# EasyEDA Pro project wavie-rgb-board.epro

# Schematic Schematic1
Board Name: Board1; Create Date: 2026-03-26; Page Name: P1; Project Name: Wavie RGB Board; Schematic Name: Schematic1; Update Date: 2026-06-10; Company: ReefMetrics; Page Size: A4; Version: V1.0
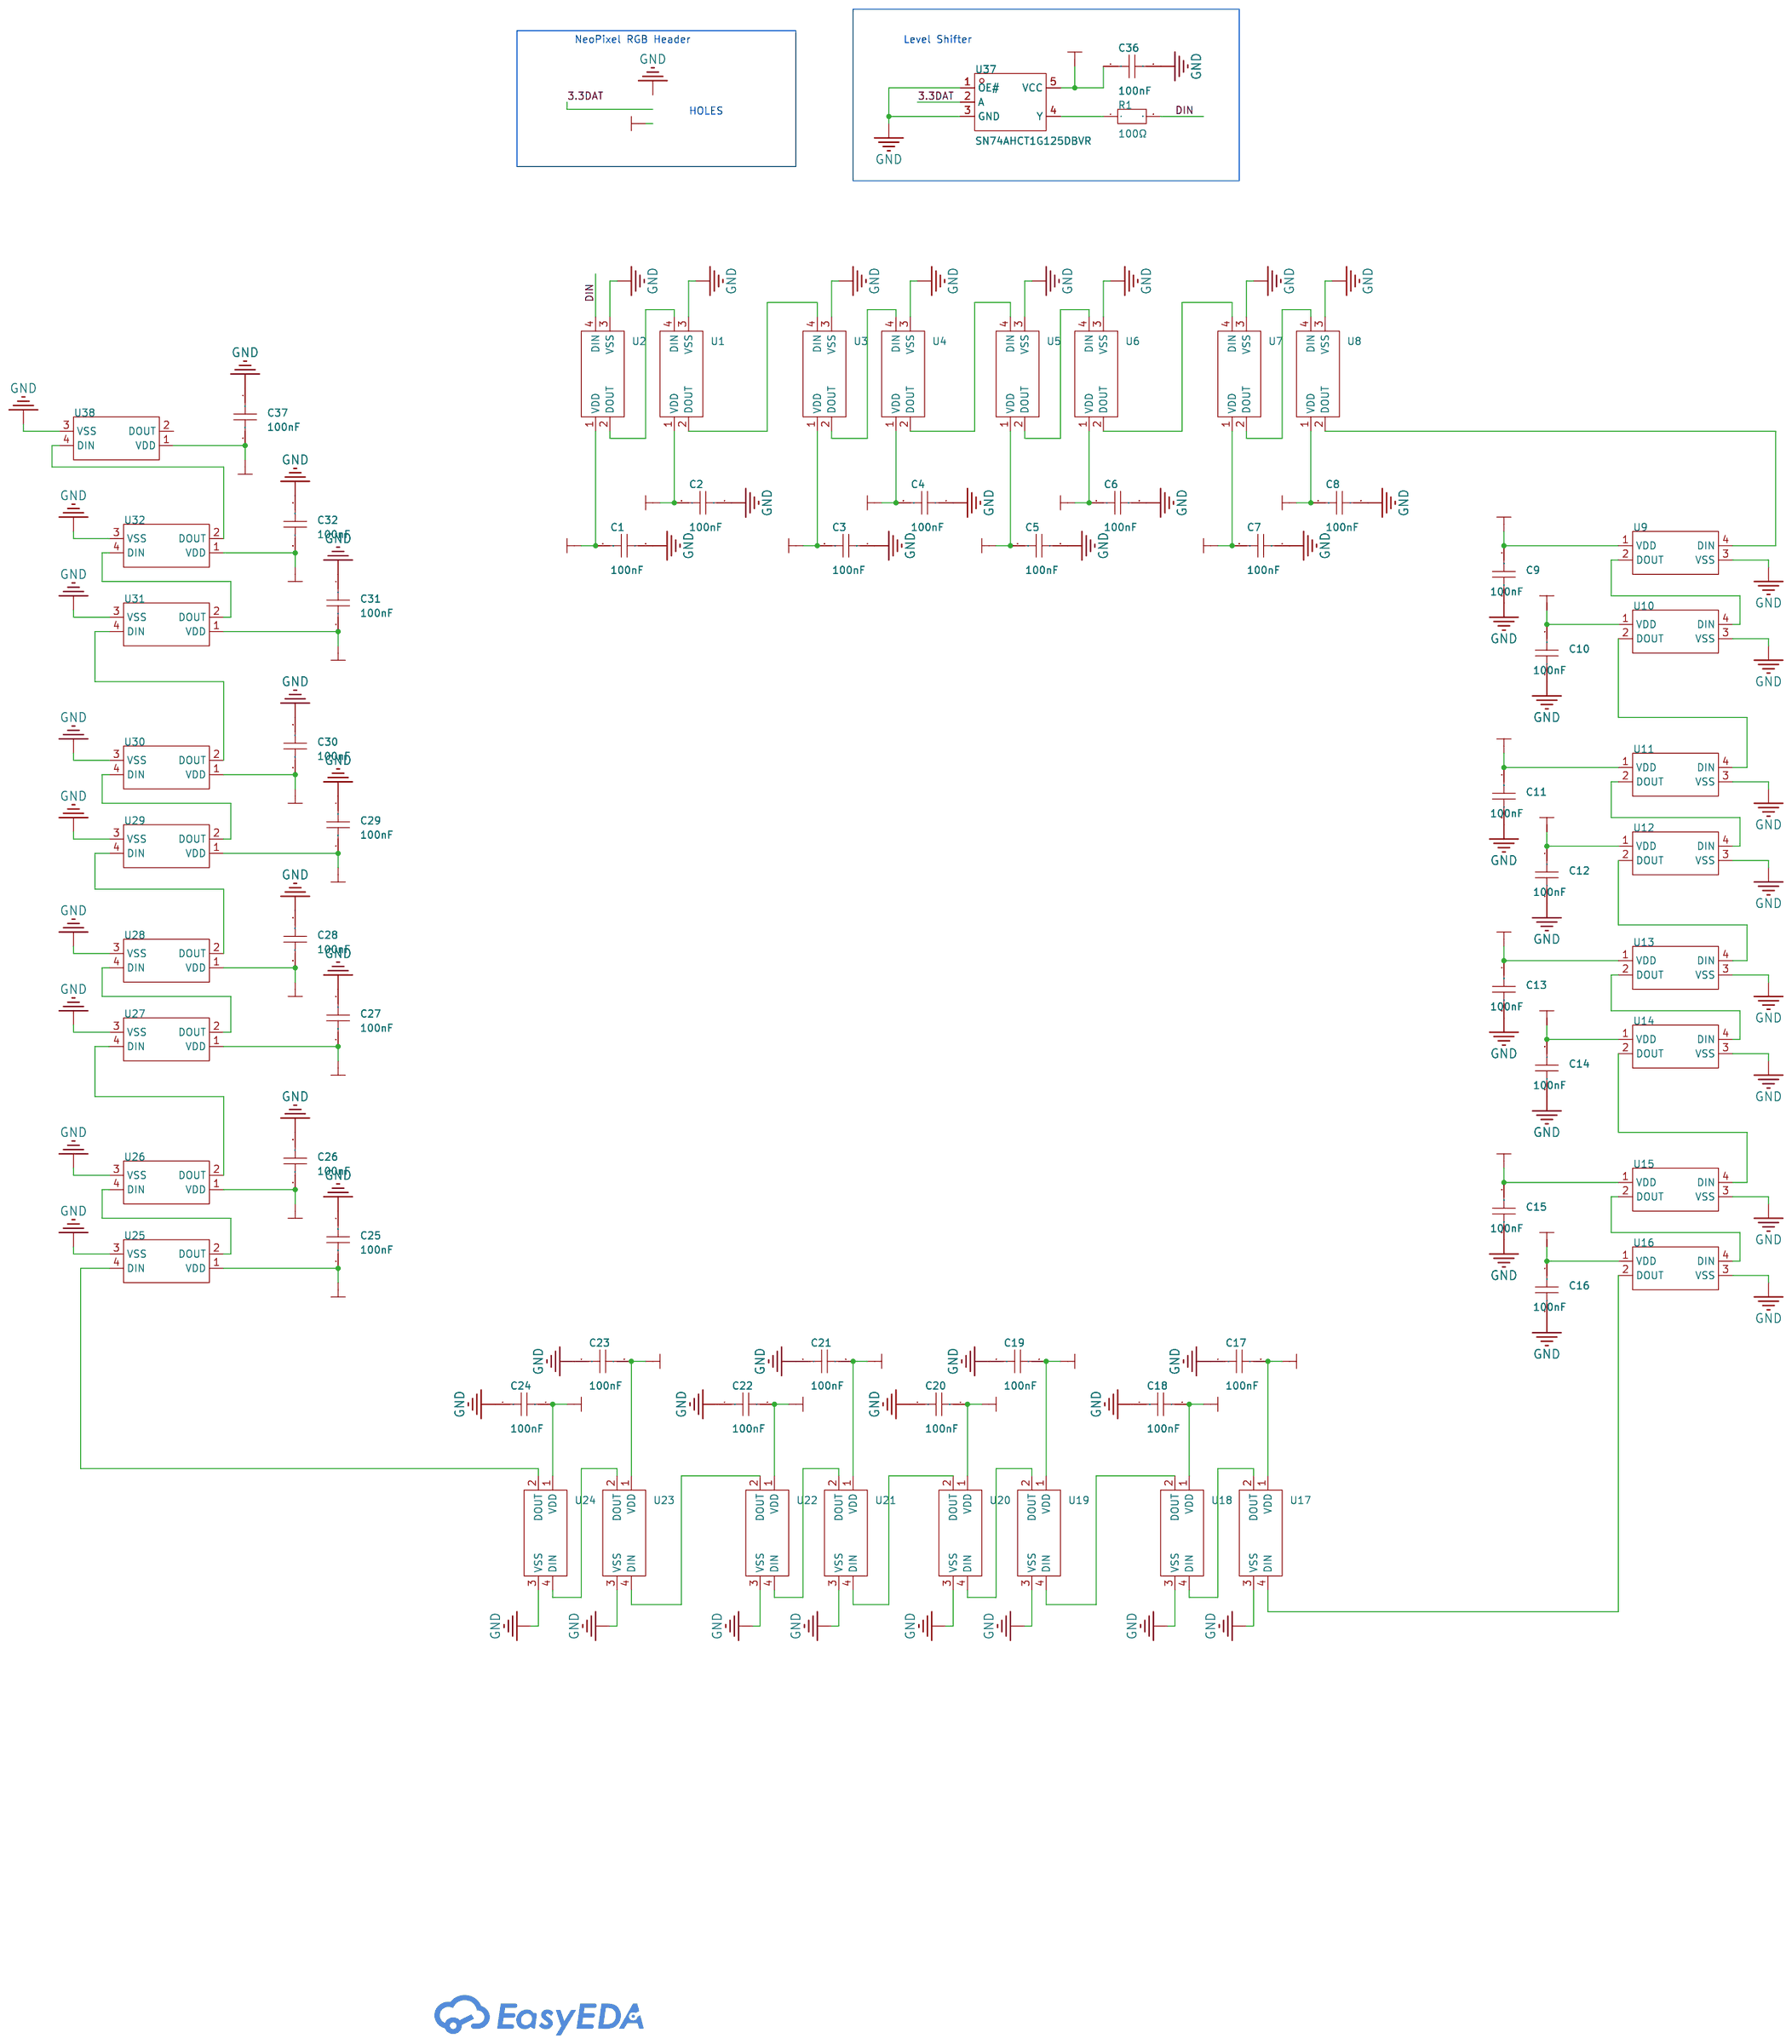
[diagram p0: schematic sheet]

## Parts
C1  100nF  [C0603]
C2  100nF  [C0603]
C3  100nF  [C0603]
C4  100nF  [C0603]
C5  100nF  [C0603]
C6  100nF  [C0603]
C7  100nF  [C0603]
C8  100nF  [C0603]
C9  100nF  [C0603]
C10  100nF  [C0603]
C11  100nF  [C0603]
C12  100nF  [C0603]
C13  100nF  [C0603]
C14  100nF  [C0603]
C15  100nF  [C0603]
C16  100nF  [C0603]
C17  100nF  [C0603]
C18  100nF  [C0603]
C19  100nF  [C0603]
C20  100nF  [C0603]
C21  100nF  [C0603]
C22  100nF  [C0603]
C23  100nF  [C0603]
C24  100nF  [C0603]
C25  100nF  [C0603]
C26  100nF  [C0603]
C27  100nF  [C0603]
C28  100nF  [C0603]
C29  100nF  [C0603]
C30  100nF  [C0603]
C31  100nF  [C0603]
C32  100nF  [C0603]
C36  100nF  [C0603]
C37  100nF  [C0603]
R1  100Ω  [R0603]
U1  WS2812B-MINI-V6  [LED-SMD_4P-L3.5-W3.5-TL_WS2812B]
U2  WS2812B-MINI-V6  [LED-SMD_4P-L3.5-W3.5-TL_WS2812B]
U3  WS2812B-MINI-V6  [LED-SMD_4P-L3.5-W3.5-TL_WS2812B]
U4  WS2812B-MINI-V6  [LED-SMD_4P-L3.5-W3.5-TL_WS2812B]
U5  WS2812B-MINI-V6  [LED-SMD_4P-L3.5-W3.5-TL_WS2812B]
U6  WS2812B-MINI-V6  [LED-SMD_4P-L3.5-W3.5-TL_WS2812B]
U7  WS2812B-MINI-V6  [LED-SMD_4P-L3.5-W3.5-TL_WS2812B]
U8  WS2812B-MINI-V6  [LED-SMD_4P-L3.5-W3.5-TL_WS2812B]
U9  WS2812B-MINI-V6  [LED-SMD_4P-L3.5-W3.5-TL_WS2812B]
U10  WS2812B-MINI-V6  [LED-SMD_4P-L3.5-W3.5-TL_WS2812B]
U11  WS2812B-MINI-V6  [LED-SMD_4P-L3.5-W3.5-TL_WS2812B]
U12  WS2812B-MINI-V6  [LED-SMD_4P-L3.5-W3.5-TL_WS2812B]
U13  WS2812B-MINI-V6  [LED-SMD_4P-L3.5-W3.5-TL_WS2812B]
U14  WS2812B-MINI-V6  [LED-SMD_4P-L3.5-W3.5-TL_WS2812B]
U15  WS2812B-MINI-V6  [LED-SMD_4P-L3.5-W3.5-TL_WS2812B]
U16  WS2812B-MINI-V6  [LED-SMD_4P-L3.5-W3.5-TL_WS2812B]
U17  WS2812B-MINI-V6  [LED-SMD_4P-L3.5-W3.5-TL_WS2812B]
U18  WS2812B-MINI-V6  [LED-SMD_4P-L3.5-W3.5-TL_WS2812B]
U19  WS2812B-MINI-V6  [LED-SMD_4P-L3.5-W3.5-TL_WS2812B]
U20  WS2812B-MINI-V6  [LED-SMD_4P-L3.5-W3.5-TL_WS2812B]
U21  WS2812B-MINI-V6  [LED-SMD_4P-L3.5-W3.5-TL_WS2812B]
U22  WS2812B-MINI-V6  [LED-SMD_4P-L3.5-W3.5-TL_WS2812B]
U23  WS2812B-MINI-V6  [LED-SMD_4P-L3.5-W3.5-TL_WS2812B]
U24  WS2812B-MINI-V6  [LED-SMD_4P-L3.5-W3.5-TL_WS2812B]
U25  WS2812B-MINI-V6  [LED-SMD_4P-L3.5-W3.5-TL_WS2812B]
U26  WS2812B-MINI-V6  [LED-SMD_4P-L3.5-W3.5-TL_WS2812B]
U27  WS2812B-MINI-V6  [LED-SMD_4P-L3.5-W3.5-TL_WS2812B]
U28  WS2812B-MINI-V6  [LED-SMD_4P-L3.5-W3.5-TL_WS2812B]
U29  WS2812B-MINI-V6  [LED-SMD_4P-L3.5-W3.5-TL_WS2812B]
U30  WS2812B-MINI-V6  [LED-SMD_4P-L3.5-W3.5-TL_WS2812B]
U31  WS2812B-MINI-V6  [LED-SMD_4P-L3.5-W3.5-TL_WS2812B]
U32  WS2812B-MINI-V6  [LED-SMD_4P-L3.5-W3.5-TL_WS2812B]
U37  SN74AHCT1G125DBVR  [SOT-23-5_L3.0-W1.7-P0.95-LS2.8-BR]
U38  WS2812B-MINI-V6  [LED-SMD_4P-L3.5-W3.5-TL_WS2812B]

## Library data of the parts
C1-C32 C37 = CC0603KRX7R9BB104: Capacitance:100nF Tolerance:±10% Tolerance:±10% Voltage Rating:50V Temperature Coefficient:X7R; LCSC Part Name: 100nF ±10% 50V; Supplier Part: C14663; Manufacturer: YAGEO(国巨); Supplier Footprint: 0603; Datasheet: https://item.szlcsc.com/datasheet/CC0603KRX7R9BB104/15331.html; Supplier: LCSC; Tolerance: ±10%; Voltage Rating: 50V; Temperature Coefficient: X7R
C36 = 0603ZD104KAT2A: Capacitance:100nF Tolerance:±10% Tolerance:±10% Voltage Rating:10V Temperature Coefficient:X5R; LCSC Part Name: 100nF ±10% 10V; Supplier Part: C1856507; Manufacturer: Kyocera AVX; Supplier Footprint: 0603; JLCPCB Part Class: Extended Part; Supplier: LCSC; Tolerance: ±10%; Voltage Rating: 10V; Temperature Coefficient: X5R
R1 = THD03G1000BT: Type:Thin Film Resistor Resistance:100Ω Tolerance:±0.1% Tolerance:±0.1% Power(Watts):100mW Voltage-Supply(Max):75V Temperature Coefficient:±25ppm/℃ Temperature Coefficient:±25ppm/℃ Operating Temperature:-55℃~+155℃ Operating Temperature:-55℃~+155℃; LCSC Part Name: 薄膜电阻 100Ω ±0.1% 100mW; Supplier Part: C47120007; Manufacturer: FH(风华); Supplier Footprint: 0603; JLCPCB Part Class: Extended Part; Datasheet: https://item.szlcsc.com/datasheet/THD03G1000BT/49315409.html; Supplier: LCSC; Type: Thin Film Resistor; Tolerance: ±0.1%; Power(Watts): 100mW; Voltage-Supply(Max): 75V; Temperature Coefficient: ±25ppm/℃; Operating Temperature: -55℃~+155℃
U1-U32 U38 = WS2812B-MINI-V6: Supplier Part: C52941386; Manufacturer: worldsemi; Supplier Footprint: SMD3535-4P; JLCPCB Part Class: Extended Part; Datasheet: https://item.szlcsc.com/datasheet/WS2812B-MINI-V6/55856749.html; Supplier: LCSC
U37 = SN74AHCT1G125DBVR: Input type:- output type:Tri-State Voltage - Supply:4.5V~5.5V Voltage - Supply:4.5V~5.5V Number of Elements:1 Number of Bits per Element:1 Channel Type:Unidirectional Current - Output Low(IOL):8mA Current - Output High(IOH):8mA Logic Family:74AHCT Operati; LCSC Part Name: 三态输出，单路总线缓冲门; Supplier Part: C7484; Manufacturer: TI(德州仪器); Supplier Footprint: SOT-23-5; Datasheet: https://www.ti.com/cn/lit/gpn/sn74ahct1g125; Supplier: LCSC; output type: Tri-State; Voltage - Supply: 4.5V~5.5V; Number of Elements: 1; Number of Bits per Element: 1; Channel Type: Unidirectional; Current - Output Low(IOL): 8mA; Current - Output High(IOH): 8mA; Logic Family: 74AHCT; Operating Temperature: -40℃~+125℃; Quiescent Current: 10uA; Propagation Delay: 6.5ns@5V,15pF

## Nets
5V: C1.2 C2.2 C3.2 C4.2 C5.2 C6.2 C7.2 C8.2 C9.2 C10.2 C11.2 C12.2 C13.2 C14.2 C15.2 C16.2 C17.2 C18.2 C19.2 C20.2 C21.2 C22.2 C23.2 C24.2 C25.2 C26.2 C27.2 C28.2 C29.2 C30.2 C31.2 C32.2 C36.1 C37.2 U1.1(VDD) U2.1(VDD) U3.1(VDD) U4.1(VDD) U5.1(VDD) U6.1(VDD) U7.1(VDD) U8.1(VDD) U9.1(VDD) U10.1(VDD) U11.1(VDD) U12.1(VDD) U13.1(VDD) U14.1(VDD) U15.1(VDD) U16.1(VDD) U17.1(VDD) U18.1(VDD) U19.1(VDD) U20.1(VDD) U21.1(VDD) U22.1(VDD) U23.1(VDD) U24.1(VDD) U25.1(VDD) U26.1(VDD) U27.1(VDD) U28.1(VDD) U29.1(VDD) U30.1(VDD) U31.1(VDD) U32.1(VDD) U37.5(VCC) U38.1(VDD)
GND: C1.1 C2.1 C3.1 C4.1 C5.1 C6.1 C7.1 C8.1 C9.1 C10.1 C11.1 C12.1 C13.1 C14.1 C15.1 C16.1 C17.1 C18.1 C19.1 C20.1 C21.1 C22.1 C23.1 C24.1 C25.1 C26.1 C27.1 C28.1 C29.1 C30.1 C31.1 C32.1 C36.2 C37.1 U1.3(VSS) U2.3(VSS) U3.3(VSS) U4.3(VSS) U5.3(VSS) U6.3(VSS) U7.3(VSS) U8.3(VSS) U9.3(VSS) U10.3(VSS) U11.3(VSS) U12.3(VSS) U13.3(VSS) U14.3(VSS) U15.3(VSS) U16.3(VSS) U17.3(VSS) U18.3(VSS) U19.3(VSS) U20.3(VSS) U21.3(VSS) U22.3(VSS) U23.3(VSS) U24.3(VSS) U25.3(VSS) U26.3(VSS) U27.3(VSS) U28.3(VSS) U29.3(VSS) U30.3(VSS) U31.3(VSS) U32.3(VSS) U37.1(OE#) U37.3(GND) U38.3(VSS)
3.3DAT: U37.2(A)
DIN: R1.2 U2.4(DIN)
$1N3068: U1.4(DIN) U2.2(DOUT)
$1N3711: U3.2(DOUT) U4.4(DIN)
$1N3739: U1.2(DOUT) U3.4(DIN)
$1N4176: U5.2(DOUT) U6.4(DIN)
$1N4201: U7.2(DOUT) U8.4(DIN)
$1N4218: U6.2(DOUT) U7.4(DIN)
$1N4237: U4.2(DOUT) U5.4(DIN)
$1N5098: U9.2(DOUT) U10.4(DIN)
$1N5123: U11.2(DOUT) U12.4(DIN)
$1N5140: U10.2(DOUT) U11.4(DIN)
$1N5150: U13.2(DOUT) U14.4(DIN)
$1N5172: U15.2(DOUT) U16.4(DIN)
$1N5189: U14.2(DOUT) U15.4(DIN)
$1N5194: U12.2(DOUT) U13.4(DIN)
$1N8852: U17.2(DOUT) U18.4(DIN)
$1N8877: U19.2(DOUT) U20.4(DIN)
$1N8894: U18.2(DOUT) U19.4(DIN)
$1N8904: U21.2(DOUT) U22.4(DIN)
$1N8926: U23.2(DOUT) U24.4(DIN)
$1N8943: U22.2(DOUT) U23.4(DIN)
$1N8948: U20.2(DOUT) U21.4(DIN)
$1N8958: U25.2(DOUT) U26.4(DIN)
$1N8980: U27.2(DOUT) U28.4(DIN)
$1N8997: U26.2(DOUT) U27.4(DIN)
$1N9007: U29.2(DOUT) U30.4(DIN)
$1N9029: U31.2(DOUT) U32.4(DIN)
$1N9046: U30.2(DOUT) U31.4(DIN)
$1N9051: U28.2(DOUT) U29.4(DIN)
$1N11106: U8.2(DOUT) U9.4(DIN)
$1N11277: U24.2(DOUT) U25.4(DIN)
$1N11280: U16.2(DOUT) U17.4(DIN)
$1N13924: R1.1 U37.4(Y)
$1N16288: U32.2(DOUT) U38.4(DIN)

Not connected (* = marked no-connect by the designer): U38 2(DOUT)

## Notes on the sheet
- NeoPixel RGB Header
- Level Shifter
- HOLES

# Board PCB1
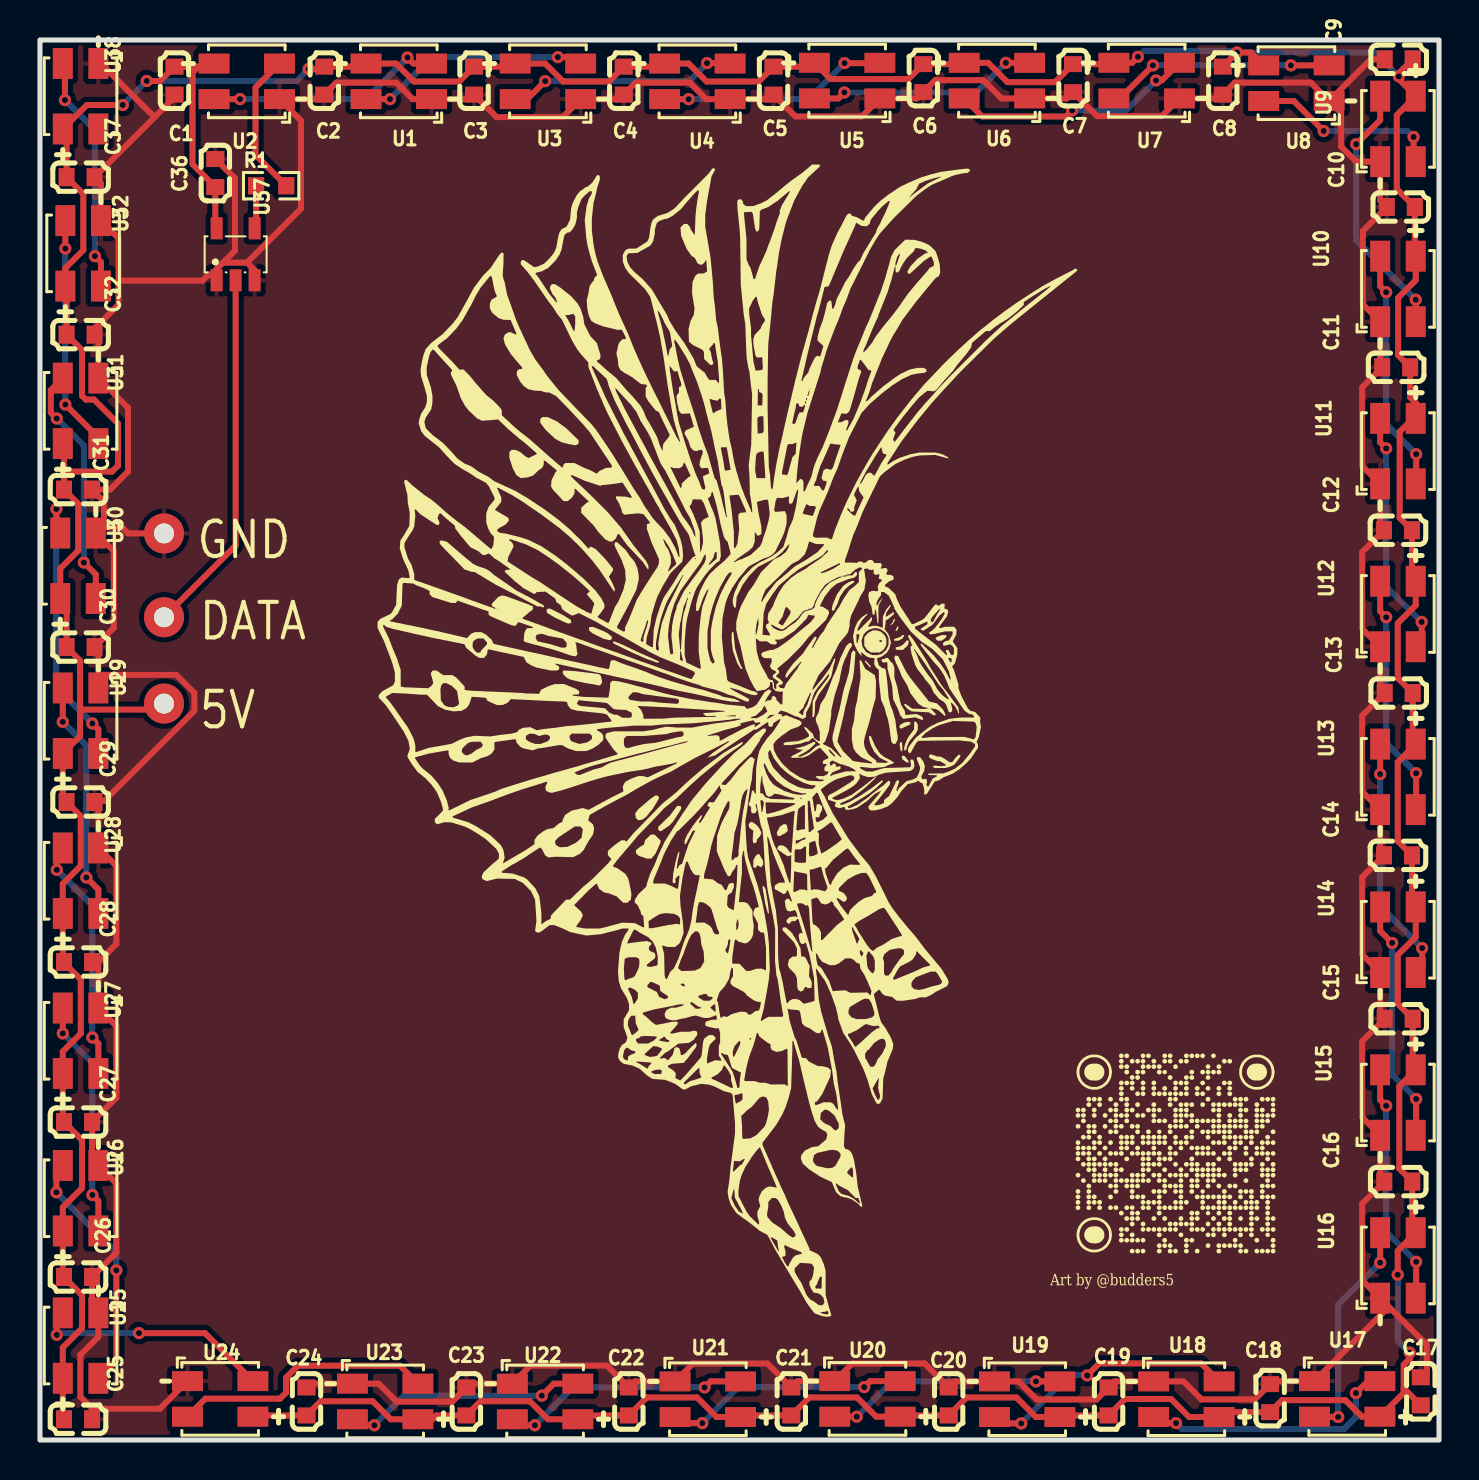
[diagram p1: board, top side]
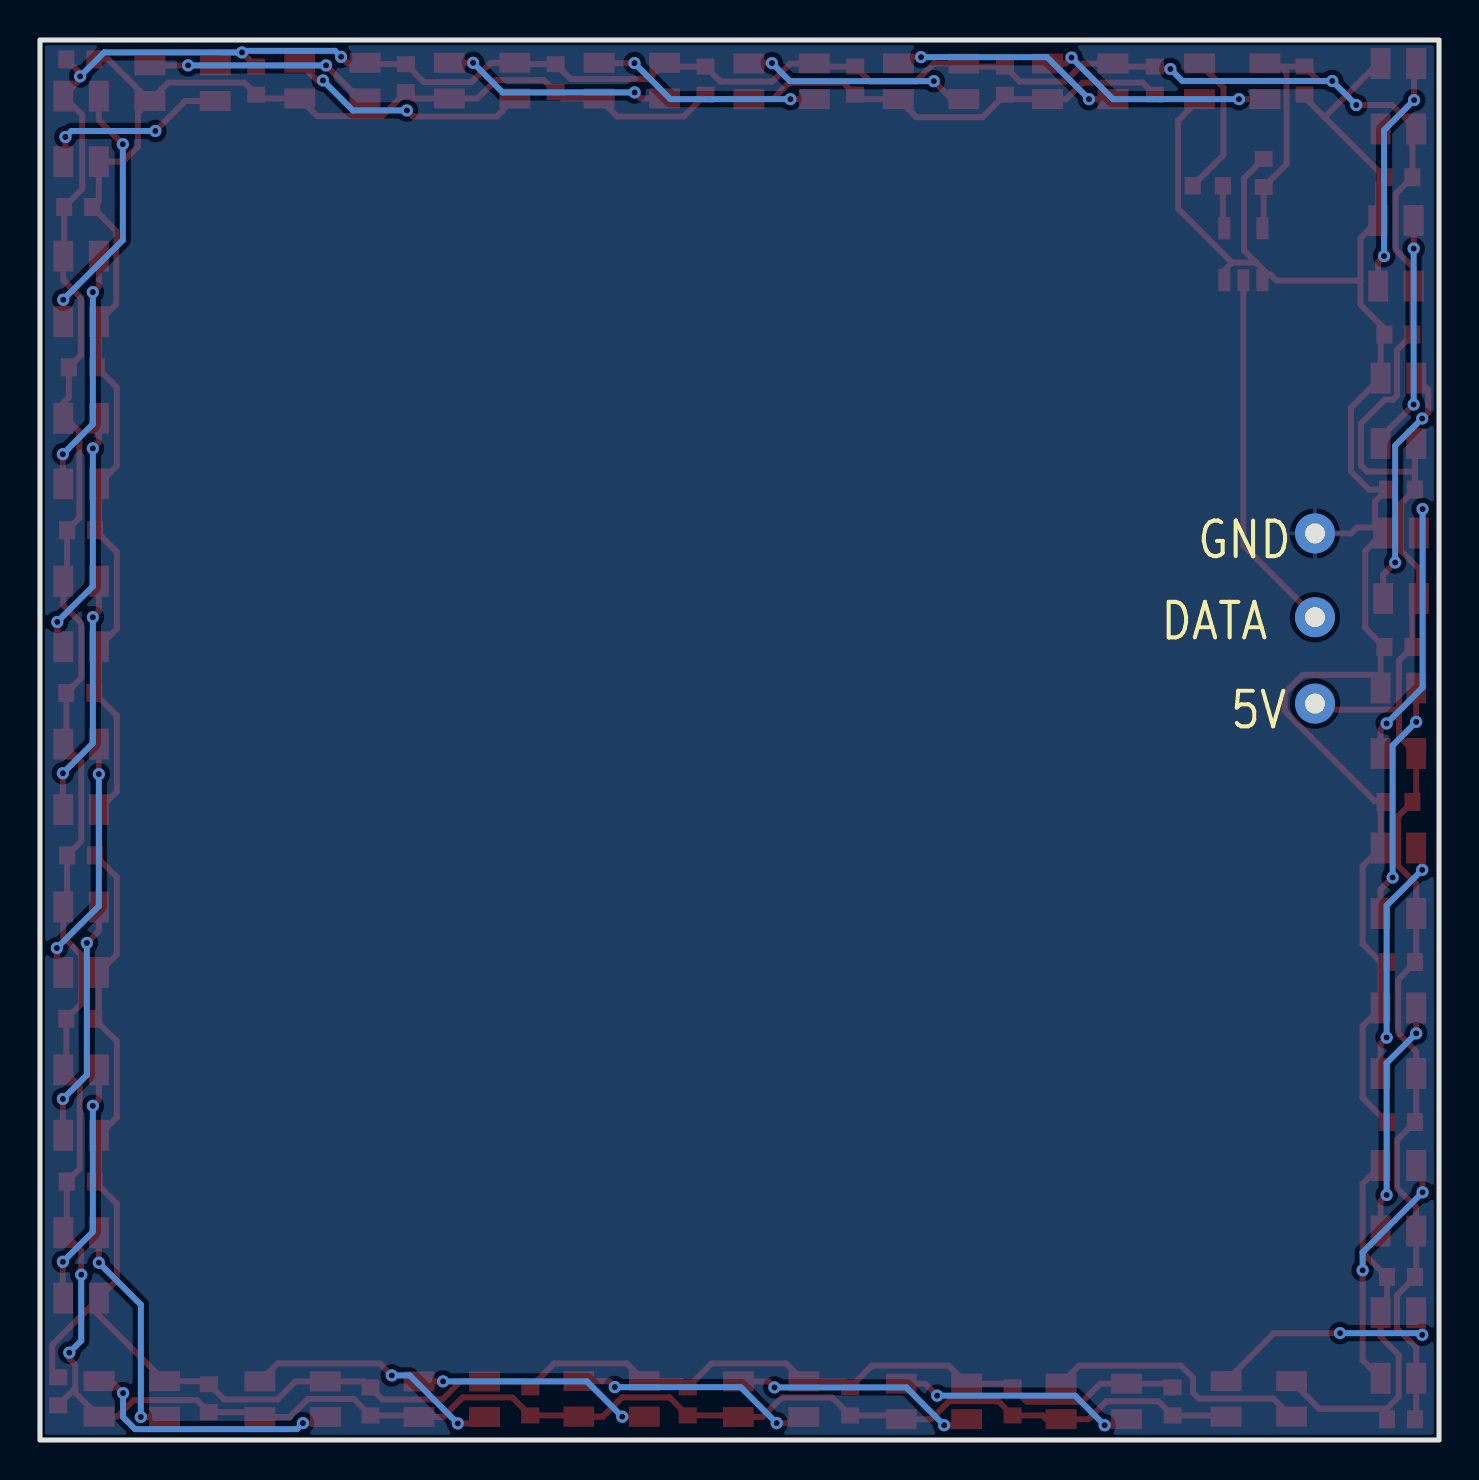
[diagram p2: board, bottom side, seen from below]

Outline 70 x 70 mm; copper layers: Top Layer, Bottom Layer. Coordinates in mm from the lower left corner of the outline.
Outline path: rectangle 0,70 70,0
Stack: Top Layer 0.035mm / Dielectric1 1.51mm FR4 er 4.5 / Bottom Layer 0.035mm

## Design rules (mm)
template: Custom Config
spacing copperThickness1oz (default): track to track 0.102, other pairs 0.152 to 0.3
spacing copperThickness2oz: track to track 0.203, other pairs 0.152 to 0.3
track width copperThickness1oz (default): min 0.3, default 0.3, max 2.54
track width copperThickness2oz: min 0.203, default 0.254, max 2.54
differential pair differentialPair (default): width min 0.127, default 0.254, max 2.54; gap min 0.152, default 0.152
via viaSize (default): diameter min 0.5, default 0.61, max 10; hole min 0.3, default 0.305, max 6.3

## Placement (name value [footprint] x y rotation side)
C1  100nF  [C0603]  6.73 67.97 90 top
C2  100nF  [C0603]  14.22 67.97 90 top
C3  100nF  [C0603]  21.72 67.97 90 top
C4  100nF  [C0603]  29.21 67.97 90 top
C5  100nF  [C0603]  36.7 67.97 90 top
C6  100nF  [C0603]  44.2 68.09 90 top
C7  100nF  [C0603]  51.69 68.09 90 top
C8  100nF  [C0603]  59.18 67.97 90 top
C9  100nF  [C0603]  67.98 69.03 0 top
C10  100nF  [C0603]  68.09 61.65 0 top
C11  100nF  [C0603]  67.85 53.64 0 top
C12  100nF  [C0603]  67.95 45.49 0 top
C13  100nF  [C0603]  67.98 37.35 0 top
C14  100nF  [C0603]  67.95 29.23 0 top
C15  100nF  [C0603]  67.98 21.06 0 top
C16  100nF  [C0603]  67.96 12.92 0 top
C17  100nF  [C0603]  69.09 2.44 270 top
C18  100nF  [C0603]  61.55 2.09 270 top
C19  100nF  [C0603]  53.47 1.93 270 top
C20  100nF  [C0603]  45.47 1.93 270 top
C21  100nF  [C0603]  37.59 1.93 270 top
C22  100nF  [C0603]  29.46 1.93 270 top
C23  100nF  [C0603]  21.34 1.93 270 top
C24  100nF  [C0603]  13.33 1.93 270 top
C25  100nF  [C0603]  1.9 1.04 180 top
C26  100nF  [C0603]  1.9 8.15 180 top
C27  100nF  [C0603]  1.9 15.9 180 top
C28  100nF  [C0603]  1.9 23.9 180 top
C29  100nF  [C0603]  2.03 31.9 180 top
C30  100nF  [C0603]  2.03 39.65 180 top
C31  100nF  [C0603]  1.9 47.52 180 top
C32  100nF  [C0603]  2.03 55.27 180 top
C36  100nF  [C0603]  8.77 63.35 90 top
C37  100nF  [C0603]  2.03 63.14 180 top
NOREF  -  [Pad_e12]  6.21 36.82 270 top
NOREF#2  -  [Pad_e11]  6.21 41.14 270 top
NOREF#3  -  [Pad_e10]  6.21 45.33 270 top
R1  100Ω  [R0603]  11.57 62.71 0 top
U1  WS2812B-MINI-V6  [LED-SMD_4P-L3.5-W3.5-TL_WS2812B]  17.95 67.93 0 top
U2  WS2812B-MINI-V6  [LED-SMD_4P-L3.5-W3.5-TL_WS2812B]  10.35 67.93 0 top
U3  WS2812B-MINI-V6  [LED-SMD_4P-L3.5-W3.5-TL_WS2812B]  25.41 67.93 0 top
U4  WS2812B-MINI-V6  [LED-SMD_4P-L3.5-W3.5-TL_WS2812B]  32.89 67.93 0 top
U5  WS2812B-MINI-V6  [LED-SMD_4P-L3.5-W3.5-TL_WS2812B]  40.39 67.97 0 top
U6  WS2812B-MINI-V6  [LED-SMD_4P-L3.5-W3.5-TL_WS2812B]  47.88 67.97 0 top
U7  WS2812B-MINI-V6  [LED-SMD_4P-L3.5-W3.5-TL_WS2812B]  55.37 67.97 0 top
U8  WS2812B-MINI-V6  [LED-SMD_4P-L3.5-W3.5-TL_WS2812B]  62.86 67.84 0 top
U9  WS2812B-MINI-V6  [LED-SMD_4P-L3.5-W3.5-TL_WS2812B]  67.95 65.56 270 top
U10  WS2812B-MINI-V6  [LED-SMD_4P-L3.5-W3.5-TL_WS2812B]  67.95 57.55 270 top
U11  WS2812B-MINI-V6  [LED-SMD_4P-L3.5-W3.5-TL_WS2812B]  67.94 49.44 270 top
U12  WS2812B-MINI-V6  [LED-SMD_4P-L3.5-W3.5-TL_WS2812B]  67.94 41.3 270 top
U13  WS2812B-MINI-V6  [LED-SMD_4P-L3.5-W3.5-TL_WS2812B]  67.94 33.16 270 top
U14  WS2812B-MINI-V6  [LED-SMD_4P-L3.5-W3.5-TL_WS2812B]  67.94 25.01 270 top
U15  WS2812B-MINI-V6  [LED-SMD_4P-L3.5-W3.5-TL_WS2812B]  67.94 16.87 270 top
U16  WS2812B-MINI-V6  [LED-SMD_4P-L3.5-W3.5-TL_WS2812B]  67.94 8.73 270 top
U17  WS2812B-MINI-V6  [LED-SMD_4P-L3.5-W3.5-TL_WS2812B]  65.4 2.06 180 top
U18  WS2812B-MINI-V6  [LED-SMD_4P-L3.5-W3.5-TL_WS2812B]  57.36 2.04 180 top
U19  WS2812B-MINI-V6  [LED-SMD_4P-L3.5-W3.5-TL_WS2812B]  49.39 2.04 180 top
U20  WS2812B-MINI-V6  [LED-SMD_4P-L3.5-W3.5-TL_WS2812B]  41.4 2.06 180 top
U21  WS2812B-MINI-V6  [LED-SMD_4P-L3.5-W3.5-TL_WS2812B]  33.42 2.04 180 top
U22  WS2812B-MINI-V6  [LED-SMD_4P-L3.5-W3.5-TL_WS2812B]  25.27 1.93 180 top
U23  WS2812B-MINI-V6  [LED-SMD_4P-L3.5-W3.5-TL_WS2812B]  17.27 1.93 180 top
U24  WS2812B-MINI-V6  [LED-SMD_4P-L3.5-W3.5-TL_WS2812B]  9.02 2.06 180 top
U25  WS2812B-MINI-V6  [LED-SMD_4P-L3.5-W3.5-TL_WS2812B]  2.03 4.72 90 top
U26  WS2812B-MINI-V6  [LED-SMD_4P-L3.5-W3.5-TL_WS2812B]  2.03 12.09 90 top
U27  WS2812B-MINI-V6  [LED-SMD_4P-L3.5-W3.5-TL_WS2812B]  2.03 19.96 90 top
U28  WS2812B-MINI-V6  [LED-SMD_4P-L3.5-W3.5-TL_WS2812B]  2.03 27.96 90 top
U29  WS2812B-MINI-V6  [LED-SMD_4P-L3.5-W3.5-TL_WS2812B]  2.03 35.96 90 top
U30  WS2812B-MINI-V6  [LED-SMD_4P-L3.5-W3.5-TL_WS2812B]  1.9 43.71 90 top
U31  WS2812B-MINI-V6  [LED-SMD_4P-L3.5-W3.5-TL_WS2812B]  2.03 51.46 90 top
U32  WS2812B-MINI-V6  [LED-SMD_4P-L3.5-W3.5-TL_WS2812B]  2.16 59.33 90 top
U37  SN74AHCT1G125DBVR  [SOT-23-5_L3.0-W1.7-P0.95-LS2.8-BR]  9.79 59.28 270 top
U38  WS2812B-MINI-V6  [LED-SMD_4P-L3.5-W3.5-TL_WS2812B]  2.03 67.19 90 top

## Footprints (pads in the part's own frame, mm; a bottom-side part is the same pattern mirrored in y, then rotated)
C0603
  rect 0.8x0.9 smd: 1(-0.7,0) 2(0.7,0)
LED-SMD_4P-L3.5-W3.5-TL_WS2812B
  rect 1.545x0.997 smd: 1(-1.637,0.89) 2(-1.637,-0.89) 3(1.637,-0.89) 4(1.637,0.89)
Pad_e10
  round 2 hole 1: 1(0,0)
Pad_e11
  round 2 hole 1: 2(0,0)
Pad_e12
  round 2 hole 1: 3(0,0)
R0603
  rect 0.806x0.864 smd: 1(-0.753,0) 2(0.753,0)
SOT-23-5_L3.0-W1.7-P0.95-LS2.8-BR
  rect 1.1x0.6 smd: 1(1.3,-0.95) 2(1.3,0) 3(1.3,0.95) 4(-1.3,0.95) 5(-1.3,-0.95)

## Nets
As in the schematic, except:
5V: C1.2 C2.2 C3.2 C4.2 C5.2 C6.2 C7.2 C8.2 C9.2 C10.2 C11.2 C12.2 C13.2 C14.2 C15.2 C16.2 C17.2 C18.2 C19.2 C20.2 C21.2 C22.2 C23.2 C24.2 C25.2 C26.2 C27.2 C28.2 C29.2 C30.2 C31.2 C32.2 C36.1 C37.2 NOREF.3 U1.1 U2.1 U3.1 U4.1 U5.1 U6.1 U7.1 U8.1 U9.1 U10.1 U11.1 U12.1 U13.1 U14.1 U15.1 U16.1 U17.1 U18.1 U19.1 U20.1 U21.1 U22.1 U23.1 U24.1 U25.1 U26.1 U27.1 U28.1 U29.1 U30.1 U31.1 U32.1 U37.5 U38.1
GND: C1.1 C2.1 C3.1 C4.1 C5.1 C6.1 C7.1 C8.1 C9.1 C10.1 C11.1 C12.1 C13.1 C14.1 C15.1 C16.1 C17.1 C18.1 C19.1 C20.1 C21.1 C22.1 C23.1 C24.1 C25.1 C26.1 C27.1 C28.1 C29.1 C30.1 C31.1 C32.1 C36.2 C37.1 NOREF#3.1 U1.3 U2.3 U3.3 U4.3 U5.3 U6.3 U7.3 U8.3 U9.3 U10.3 U11.3 U12.3 U13.3 U14.3 U15.3 U16.3 U17.3 U18.3 U19.3 U20.3 U21.3 U22.3 U23.3 U24.3 U25.3 U26.3 U27.3 U28.3 U29.3 U30.3 U31.3 U32.3 U37.1 U37.3 U38.3
3.3DAT: NOREF#2.2 U37.2

Pads without a net: U38 2

## Via types
v1: diameter 0.61, hole 0.305, Top Layer to Bottom Layer, 70 vias

## Routing (per net, layer and track width the routed paths; a pad name or vN(x,y) marks a point on that pad's centre or on a via; arc(x,y) is an arc through that point)
5V: length 305.5
  Top Layer w0.3: 1.2,48.42 1.2,49.76 U31.1 ; 1.2,48.42 3.6,48.42 3.9,48.72 3.9,50.82 2.7,52.02 2.3,52.02 2.1,52.21 2.1,54.5 C32.2 1.33,57.63 U32.1 1.27,58.59 2.17,59.49 2.17,62.31 C37.2 1.33,65.36 U38.1 2.34,66.75 v1(4.14,66.75) ; 1.2,48.42 C31.2 1.91,46.81 1.91,44.47 1.01,43.57 U30.1 1.33,41.76 C30.2 2.01,38.97 2.01,36.52 ; 1.14,24.23 U28.1 1.14,27.81 2.04,28.71 2.04,31.19 C29.2 1.14,32.09 U29.1 2.01,35.19 2.01,36.52 ; 1.14,24.23 1.14,23.93 2.04,23.03 2.04,20.33 1.14,19.43 U27.1 1.14,15.96 C27.2 2.1,15 2.1,12.6 1.14,11.63 U26.1 1.14,8.35 1.2,8.29 1.2,8.14 2.1,7.24 2.1,5.59 1.14,4.62 U25.1 1.14,1.1 C25.2 ; 1.14,24.23 C28.2 ; 68.23,2.57 68.26,2.57 C17.2 ; 68.23,2.57 68.23,3.77 68.53,4.07 v1(68.53,4.37) ; 68.23,2.57 68.23,2.36 U17.1 66.14,1.16 65.31,1.99 62.15,1.99 C18.2 59.24,1.39 U18.1 57.5,1.15 56.6,2.05 54.29,2.05 C19.2 51.11,1.23 51.03,1.15 49.83,1.15 48.85,2.13 46.37,2.13 C20.2 43.1,1.23 U20.1 41.84,1.16 40.88,2.13 38.49,2.13 C21.2 35.13,1.23 U21.1 33.85,1.15 32.87,2.13 30.36,2.13 C22.2 27.1,1.23 U22.1 25.41,1.04 24.51,1.94 22.05,1.94 C23.2 19.84,1.23 19.65,1.04 U23.1 17.55,1.04 16.65,1.94 14.04,1.94 C24.2 10.72,1.23 U24.1 ; C9.2 67.99,68.34 v1(67.99,68.18) 67.99,68.04 U9.1 67.89,66.24 67.89,62.55 C10.2 68.79,59.24 U10.1 68.83,57.99 67.95,57.11 67.95,54.23 C11.2 68.55,52.14 68.85,51.84 68.85,51.23 ; 2.01,36.52 5.91,36.52 NOREF.3 ; 7.93,68.67 C1.2 6.01,67.95 v1(5.34,67.95) ; 7.93,68.67 7.63,68.37 7.63,63.79 C36.1 8.77,60.65 U37.5 ; 7.93,68.67 8.55,68.67 U2.1 ; 68.85,51.23 68.03,50.41 68.03,46.1 C12.2 68.64,43.13 U12.1 68.83,41.74 67.93,40.84 67.93,38.1 C13.2 68.68,34.95 U13.1 67.93,33.9 67.93,29.94 C14.2 68.64,26.84 U14.1 68.83,25.15 67.93,24.25 67.93,21.81 C15.2 68.68,18.66 U15.1 68.01,17.69 68.01,13.57 C16.2 68.66,10.54 68.83,10.37 67.93,9.47 v1(67.93,8.27) ; 68.85,51.23 U11.1 ; U8.1 60.58,69.38 v1(59.89,69.38) C8.2 ; v1(54.93,69.16) 54.63,68.86 U7.1 53.67,68.8 C7.2 50.79,67.89 48.4,67.89 47.44,68.86 U6.1 46.18,68.8 C6.2 43.45,68.05 39.56,68.05 U5.1 38.56,68.67 C5.2 35.96,67.92 33.36,67.92 32.45,68.82 U4.1 31.1,68.67 C4.2 28.47,67.92 26.18,67.92 25.28,68.82 U3.1 23.62,68.67 C3.2 20.97,67.92 18.71,67.92 17.81,68.82 U1.1 16.16,68.67 C2.2 14.11,68.55 v1(13.44,68.55)
  Bottom Layer w0.3: v1(54.93,69.16) 55.23,69.46 59.85,69.46 59.89,69.42 v1(59.89,69.38) 66.79,69.38 v1(67.99,68.18) ; v1(4.14,66.75) v1(5.34,67.95) 12.84,67.95 v1(13.44,68.55) ; v1(68.53,4.37) 67.93,4.97 v1(67.93,8.27)
GND: length 315.3
  Top Layer w0.3: 13.33,2.63 13.52,2.82 U23.3 16.95,2.82 17.85,1.92 20.63,1.92 21.53,2.82 U22.3 24.54,3.72 28.37,3.72 29.46,2.63 29.77,2.93 U21.3 32.68,3.83 36.39,3.83 37.59,2.63 37.91,2.94 U20.3 40.65,3.83 44.27,3.83 45.47,2.63 45.77,2.93 U19.3 48.97,2.93 49.87,2.03 52.87,2.03 53.77,2.93 U18.3 57.21,2.93 58.11,2.03 60.78,2.03 C18.1 61.7,2.94 U17.3 67.35,6.53 67.35,6.79 ; C29.1 2.79,31.96 2.92,31.96 ; C36.2 9.76,63.09 9.76,59.47 9.16,58.87 ; 10.36,58.87 13.06,61.57 13.06,65.97 U2.3 14,67.04 C2.1 14.82,67.87 17.82,67.87 18.65,67.04 U1.3 21.49,67.04 C3.1 22.84,66.14 26.15,66.14 U3.3 28.99,67.04 C4.1 29.81,67.87 32.51,67.87 33.33,67.04 U4.3 36.48,67.04 C5.1 37.79,66.18 41.12,66.18 U5.3 43.88,67.08 C6.1 44.8,68 47.2,68 48.11,67.08 U6.3 51.37,67.08 C7.1 52.89,66.2 56.13,66.2 U7.3 58.99,67.08 C8.1 59.78,67.87 63.59,67.87 U8.3 ; 10.36,58.87 10.74,58.48 U37.3 ; 10.36,58.87 9.16,58.87 ; 9.16,58.87 8.56,58.27 ; U24.3 5.99,1.56 2.62,1.56 ; NOREF#3.1 4.41,45.33 4.11,45.63 3.21,45.63 ; 5.73,66.14 C37.1 3.05,62.83 U32.3 3.93,60.09 3.93,57.97 ; 5.73,66.14 6.73,67.14 C1.1 ; 5.73,66.14 3.05,68.83 U38.3 ; 2.92,23.9 3.82,24.8 3.82,28.7 U28.3 2.92,31.96 ; 2.92,23.9 C28.1 ; 2.92,23.9 U27.3 3.82,20.7 3.82,17.12 C27.1 2.6,14.04 U26.3 3.82,12.83 3.82,9.37 C26.1 2.6,6.68 U25.3 2.92,5.16 2.02,4.26 2.02,2.16 2.62,1.56 ; 8.56,58.27 U37.1 ; 8.56,58.27 8.43,58.27 8.13,57.97 3.93,57.97 ; C17.1 69.39,3.44 69.39,4.76 67.35,6.79 ; 67.35,6.79 U16.3 66.15,7.99 66.15,11.81 C16.1 67.05,13.12 U15.3 66.15,16.13 66.15,19.94 C15.1 67.05,21.29 U14.3 66.15,24.28 66.15,28.14 C14.1 67.05,29.42 U13.3 66.15,32.42 66.15,36.22 C13.1 67.05,37.58 U12.3 66.15,40.56 66.15,44.4 C12.1 67.05,45.68 U11.3 66.15,48.71 66.15,52.64 C11.1 67.05,53.73 U10.3 66.19,56.78 66.19,60.45 C10.1 67.05,61.98 U9.3 65.86,63.92 65.1,64.67 65.1,66.35 U8.3 ; 2.62,1.56 2.62,1.06 C25.1 ; 3.21,45.63 3.08,45.63 U30.3 3.69,44.45 3.69,40.61 C30.1 2.92,39.46 2.92,38.26 ; 3.21,45.63 3.21,46.92 C31.1 3.5,47.52 4.4,48.42 4.4,51.61 U31.3 2.92,55.08 C32.1 2.73,55.57 3.93,56.77 3.93,57.97 ; 2.92,38.26 6.82,38.26 7.72,37.36 7.72,36.46 3.22,31.96 2.92,31.96 ; 2.92,38.26 U29.3 ; U8.3 66.58,69.03 C9.1
3.3DAT: length 18.3
  Top Layer w0.3: U37.2 9.79,44.72 NOREF#2.2
DIN: length 7.2
  Top Layer w0.3: R1.2 10.78,64.25 10.78,67.62 U2.4
$1N3068: length 11.9
  Top Layer w0.3: U1.4 18.69,68.82 v1(18.39,69.12) ; v1(10.01,67.04) U2.2
  Bottom Layer w0.3: v1(18.39,69.12) 16.31,67.04 v1(10.01,67.04)
$1N3711: length 11.5
  Top Layer w0.3: U4.4 34.51,68.84 v1(33.38,68.84) ; v1(25.28,67.94) 24.38,67.04 U3.2
  Bottom Layer w0.3: v1(33.38,68.84) 32.48,67.94 v1(25.28,67.94)
$1N3739: length 11.7
  Top Layer w0.3: U3.4 26.73,69.14 v1(25.91,69.14) ; U1.2 v1(17.51,67.04)
  Bottom Layer w0.3: v1(17.51,67.04) 19.61,69.14 v1(25.91,69.14)
$1N4176: length 11.5
  Top Layer w0.3: v1(40.25,67.38) 39.95,67.08 U5.2 ; v1(48.33,68.86) U6.4
  Bottom Layer w0.3: v1(48.33,68.86) 46.85,67.38 v1(40.25,67.38)
$1N4201: length 11.5
  Top Layer w0.3: v1(55.69,68.73) 54.03,67.08 U7.2 ; v1(62.59,68.73) U8.4
  Bottom Layer w0.3: v1(55.69,68.73) v1(62.59,68.73)
$1N4218: length 12.3
  Top Layer w0.3: v1(55.84,67.98) 56.13,67.98 U7.4 ; U6.2 47.14,66.18 51.34,66.18 v1(51.64,66.48)
  Bottom Layer w0.3: v1(51.64,66.48) 54.34,66.48 v1(55.84,67.98)
$1N4237: length 11.5
  Top Layer w0.3: U5.4 42.01,68.84 v1(40.25,68.84) ; U4.2 v1(32.45,67.04)
  Bottom Layer w0.3: v1(32.45,67.04) 38.45,67.04 v1(40.25,68.84)
$1N5098: length 13
  Top Layer w0.3: v1(68.83,57.01) U10.4 ; U9.2 67.05,65.99 v1(65.86,64.79)
  Bottom Layer w0.3: v1(65.86,64.79) 65.86,59.99 v1(68.83,57.01)
$1N5123: length 12.4
  Top Layer w0.3: v1(67.35,49.58) 67.05,49.88 U11.2 ; U12.4 69.13,39.96 v1(69.13,40.9)
  Bottom Layer w0.3: v1(67.35,49.58) 67.35,42.68 v1(69.13,40.9)
$1N5140: length 12.1
  Top Layer w0.3: U10.2 67.05,57.69 v1(67.36,57.39) ; v1(68.86,49.29) 68.86,47.83 U11.4
  Bottom Layer w0.3: v1(68.86,49.29) 67.36,50.79 v1(67.36,57.39)
$1N5150: length 12.4
  Top Layer w0.3: v1(69.15,24.6) 69.15,23.7 U14.4 ; U13.2 v1(67.05,33.3)
  Bottom Layer w0.3: v1(69.15,24.6) 67.05,26.7 v1(67.05,33.3)
$1N5172: length 12.2
  Top Layer w0.3: U16.4 68.85,7.11 v1(68.85,8.91) ; U15.2 67.05,17.01 v1(67.35,16.71)
  Bottom Layer w0.3: v1(67.35,16.71) 67.35,10.41 v1(68.85,8.91)
$1N5189: length 12.2
  Top Layer w0.3: U15.4 68.85,15.25 v1(68.85,17.05) ; U14.2 67.05,25.45 v1(67.65,24.85)
  Bottom Layer w0.3: v1(68.85,17.05) 67.65,18.25 v1(67.65,24.85)
$1N5194: length 12.2
  Top Layer w0.3: v1(67.35,41.14) 67.05,41.44 U12.2 ; U13.4 68.85,31.54 v1(68.85,33.34)
  Bottom Layer w0.3: v1(68.85,33.34) 67.35,34.84 v1(67.35,41.14)
$1N8852: length 13.3
  Top Layer w0.3: U17.2 66.44,2.94 v1(65.84,2.34) ; U18.4 56.03,0.84 v1(56.84,0.84)
  Bottom Layer w0.3: v1(56.84,0.84) 57.14,0.55 65.24,0.55 65.84,1.15 v1(65.84,2.34)
$1N8877: length 12
  Top Layer w0.3: v1(40.87,1.16) U20.4 ; 51.03,2.93 v1(49.83,2.93)
  Bottom Layer w0.3: v1(49.83,2.93) 42.63,2.93 v1(40.87,1.16)
$1N8894: length 13
  Top Layer w0.3: U18.2 58.1,3.83 53,3.83 v1(52.4,3.23) ; v1(49.1,0.83) 48.08,0.83 U19.4
  Bottom Layer w0.3: v1(49.1,0.83) 51.5,3.23 v1(52.4,3.23)
$1N8904: length 12.4
  Top Layer w0.3: v1(33.25,2.63) 33.55,2.93 U21.2 ; U22.4 23.94,0.74 v1(24.76,0.74)
  Bottom Layer w0.3: v1(33.25,2.63) 26.65,2.63 v1(24.76,0.74)
$1N8926: length 13.4
  Top Layer w0.3: U23.2 18.01,3.72 12.91,3.72 12.31,3.12 12.31,2.37 12.01,2.06 8.28,2.06 U24.4
$1N8943: length 12.3
  Top Layer w0.3: U23.4 15.93,0.74 v1(16.73,0.74) ; v1(25.11,2.22) 25.71,2.82 U22.2
  Bottom Layer w0.3: v1(25.11,2.22) 18.21,2.22 v1(16.73,0.74)
$1N8948: length 12.3
  Top Layer w0.3: U21.4 32.08,0.84 v1(33.14,0.84) ; v1(41.24,2.65) 41.54,2.94 U20.2
  Bottom Layer w0.3: v1(33.14,0.84) 34.94,2.65 v1(41.24,2.65)
$1N8958: length 12.4
  Top Layer w0.3: U26.4 0.82,13.41 v1(0.82,12.38) ; v1(3.82,8.48) 3.82,3.98 U25.2
  Bottom Layer w0.3: v1(3.82,8.48) 3.82,9.38 v1(0.82,12.38)
$1N8980: length 12.3
  Top Layer w0.3: v1(0.84,28.5) 0.84,29.3 U28.4 ; v1(2.62,20.12) 2.92,19.82 U27.2
  Bottom Layer w0.3: v1(2.62,20.12) 2.62,26.72 v1(0.84,28.5)
$1N8997: length 11.9
  Top Layer w0.3: U26.2 2.92,11.95 v1(2.62,12.25) ; v1(1.14,20.33) U27.4
  Bottom Layer w0.3: v1(2.62,12.25) 2.62,18.85 v1(1.14,20.33)
$1N9007: length 14.4
  Top Layer w0.3: U30.4 0.82,45.54 v1(0.82,46.55) ; v1(2.62,35.83) 2.92,35.53 U29.2
  Bottom Layer w0.3: v1(2.62,35.83) 0.82,37.63 v1(0.82,46.55)
$1N9029: length 11.8
  Top Layer w0.3: U31.2 2.92,50.12 v1(1.27,51.77) ; v1(1.27,59.57) U32.4
  Bottom Layer w0.3: v1(1.27,51.77) v1(1.27,59.57)
$1N9046: length 12.2
  Top Layer w0.3: v1(2.19,43.87) 2.79,43.27 U30.2 ; v1(0.84,51.07) 0.54,51.37 0.54,52.5 U31.4
  Bottom Layer w0.3: v1(0.84,51.07) 2.19,49.72 v1(2.19,43.87)
$1N9051: length 12
  Top Layer w0.3: v1(1.14,35.91) U29.4 ; v1(2.32,28.13) 2.92,27.53 U28.2
  Bottom Layer w0.3: v1(2.32,28.13) 2.32,34.73 v1(1.14,35.91)
$1N11106: length 9.5
  Top Layer w0.3: U8.2 62.73,66.95 v1(64.23,65.45) ; v1(68.73,65.15) 68.73,64.03 U9.4
  Bottom Layer w0.3: v1(68.73,65.15) 68.43,65.45 v1(64.23,65.45)
$1N11277: length 12.1
  Top Layer w0.3: U24.2 8.25,5.34 v1(4.95,5.34) ; v1(0.84,5.26) 0.84,6.06 U25.4
  Bottom Layer w0.3: v1(0.84,5.26) 0.93,5.34 v1(4.95,5.34)
$1N11280: length 11.3
  Top Layer w0.3: 67.05,10.37 v1(67.05,8.87) ; U17.4 63.78,1.15 v1(64.95,1.15)
  Bottom Layer w0.3: v1(64.95,1.15) 64.95,6.77 v1(67.05,8.87)
$1N13924: length 2.2
  Top Layer w0.3: R1.1 10.81,60.66 U37.4
$1N16288: length 11.9
  Top Layer w0.3: v1(1.25,66.99) 1.25,68.72 U38.4 ; v1(2.75,59.19) 3.05,58.89 U32.2
  Bottom Layer w0.3: v1(2.75,59.19) 2.75,65.49 v1(1.25,66.99)

## Copper pours and planes (outline as drawn; the poured copper is in the pictures)
GND on Top Layer: 0,70 70,70 70,0 0,0
GND on Bottom Layer: 0,70 70,70 70,0 0,0

## Text on the board
Bottom Silkscreen Layer: 5V | GND | DATA
Top Silkscreen Layer: GND | DATA | 5V | Art by @budders5
